# EAGLE design powerSupply (EAGLE 7.7.0)
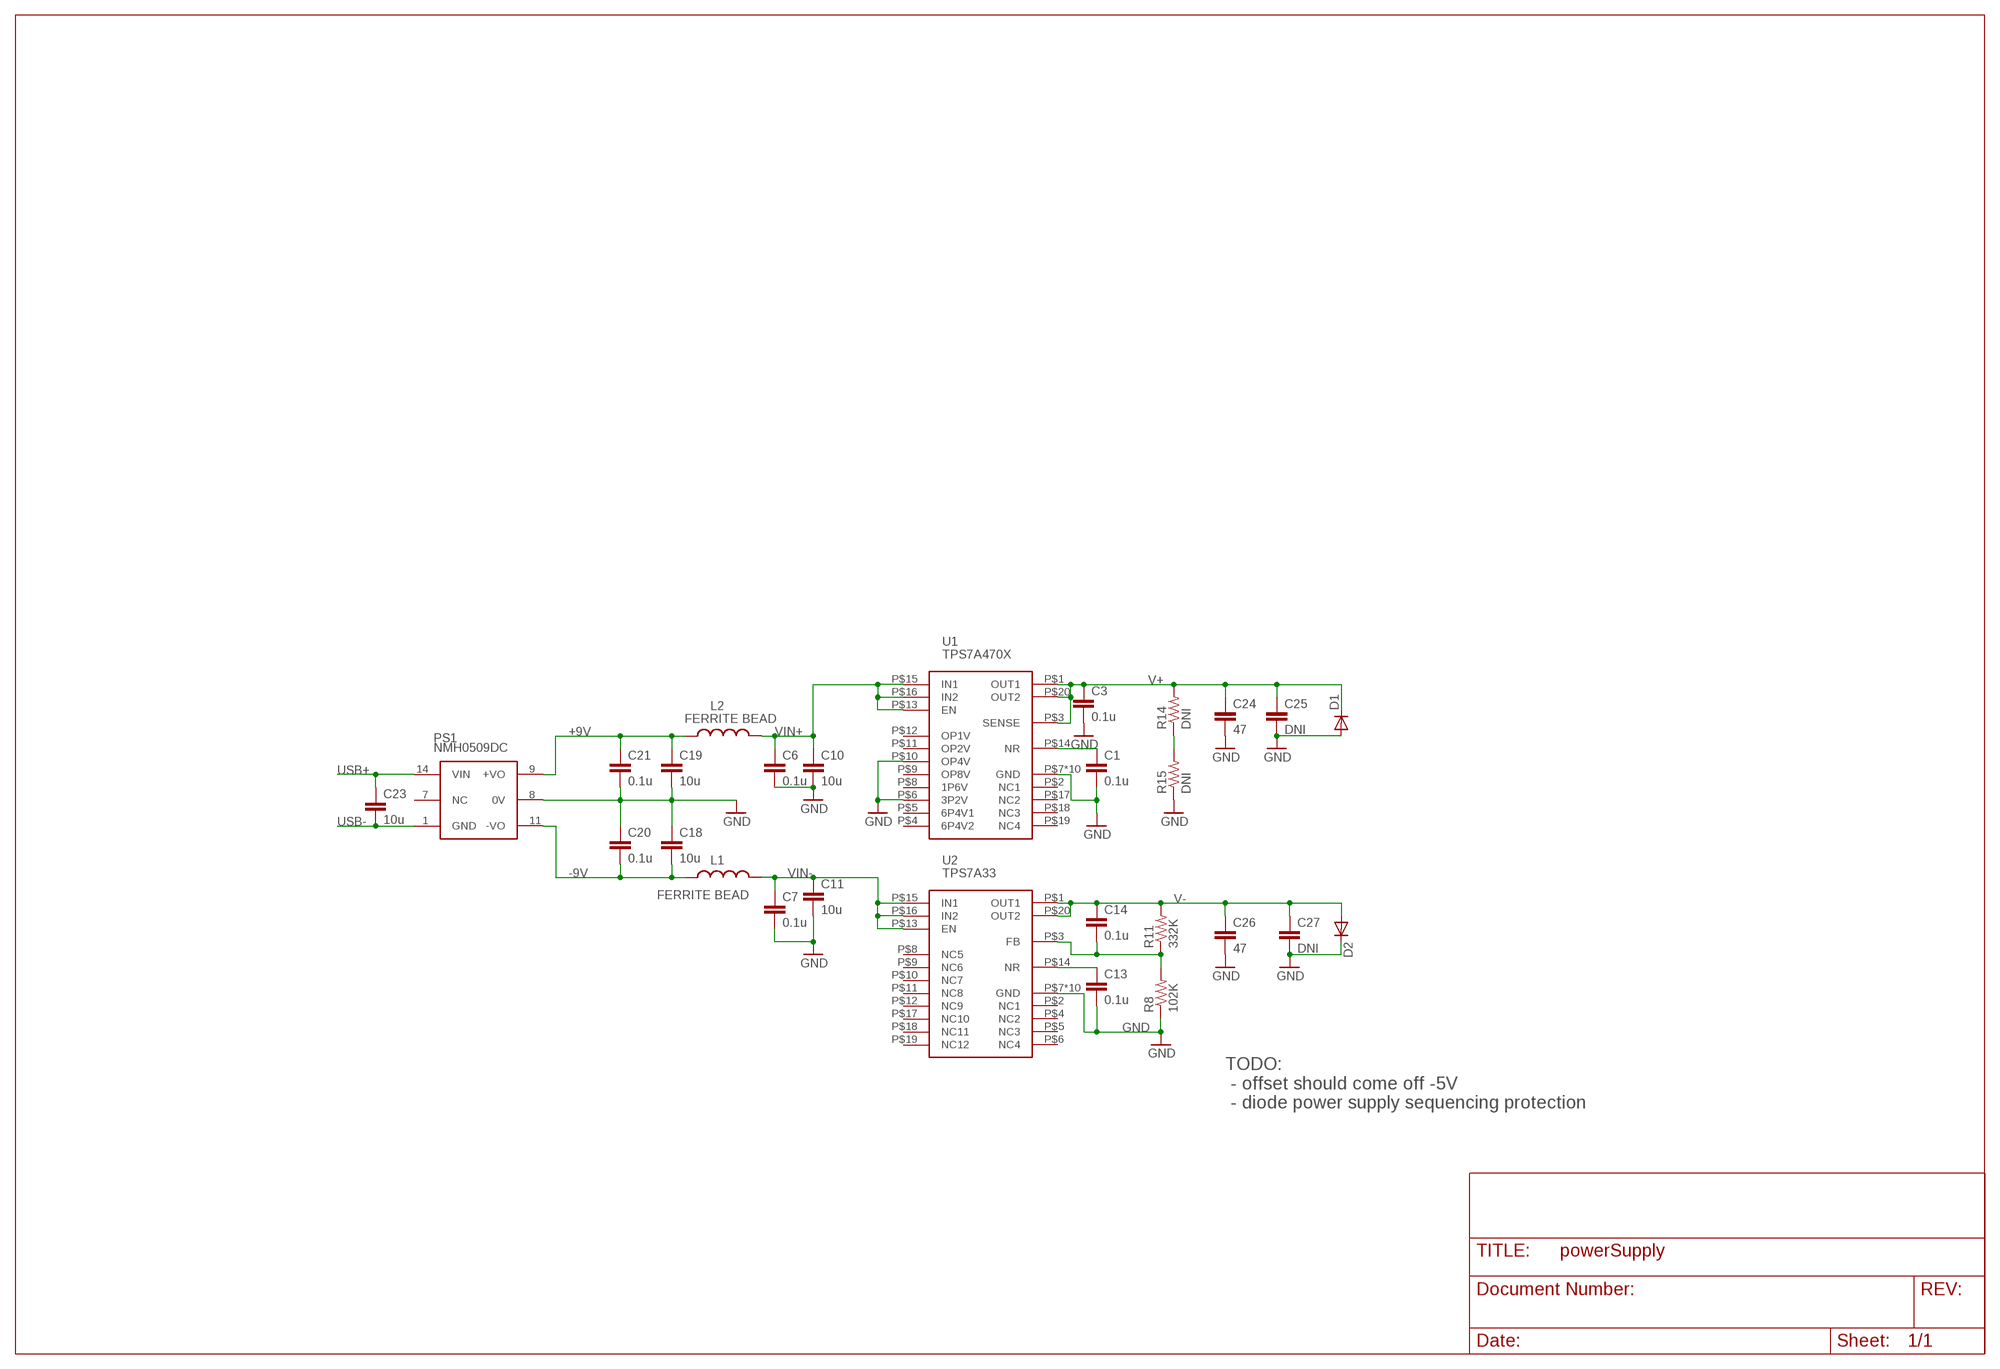
[diagram p0: schematic, sheet 1]

## Parts
C1  0.1u  CAPS0603S  [0603S]
C3  0.1u  CAPS0603S  [0603S]
C6  0.1u  CAPS0603S  [0603S]
C7  0.1u  CAPS0603S  [0603S]
C10  10u  C-EUC1206  [C1206]
C11  10u  C-EUC1206  [C1206]
C13  0.1u  CAPS0603S  [0603S]
C14  0.1u  CAPS0603S  [0603S]
C18  10u  C-EUC1206  [C1206]
C19  10u  C-EUC1206  [C1206]
C20  0.1u  CAPS0603S  [0603S]
C21  0.1u  CAPS0603S  [0603S]
C23  10u  C-EUC1206  [C1206]
C24  47  C-EUC1206  [C1206]
C25  DNI  C-EUC1206  [C1206]
C26  47  C-EUC1206  [C1206]
C27  DNI  C-EUC1206  [C1206]
D1  DIODESMA  [SMA-DIODE]
D2  DIODESMA  [SMA-DIODE]
L1  FERRITE BEAD  INDUCTOR_SM0805S  [0805S]
L2  FERRITE BEAD  INDUCTOR_SM0805S  [0805S]
PS1  NMH0509DC  DC-DC-PDS1-DUALPDM2  [PDM2]
R8  102K  R-US_R0805  [R0805]
R11  332K  R-US_R0805  [R0805]
R14  DNI  R-US_R0805  [R0805]
R15  DNI  R-US_R0805  [R0805]
U1  TPS7A470X  [VQFN-20-5X5]
U2  TPS7A33  [VQFN-20-5X5]

## Nets
+9V: C19.1 C21.1 L2.1 PS1.9(+VO)
-9V: C18.2 C20.2 L1.1 PS1.11(-VO)
GND: C1.2 C3.2 C6.2 C7.2 C10.2 C11.2 C13.2 C18.1 C19.2 C20.1 C21.2 C24.2 C25.2 C26.2 C27.2 D1.A D2.C PS1.8(0V) R8.1 R15.1 U1.P$6(3P2V) U1.P$7(GND) U1.P$10(OP4V) U1.PAD1(GND) U1.PAD2(GND) U1.PAD3(GND) U1.PAD4(GND) U1.PAD5(GND) U1.PAD6(GND) U1.PAD7(GND) U1.PAD8(GND) U1.PAD9(GND) U2.P$7(GND) U2.PAD1(GND) U2.PAD2(GND) U2.PAD3(GND) U2.PAD4(GND) U2.PAD5(GND) U2.PAD6(GND) U2.PAD7(GND) U2.PAD8(GND) U2.PAD9(GND)
N$9: C14.2 R8.2 R11.1 U2.P$3(FB)
N$15: R14.1 R15.2
N$18: C13.1 U2.P$14(NR)
N$23: C1.1 U1.P$14(NR)
USB+: C23.1 PS1.14(VIN)
USB-: C23.2 PS1.1(GND)
V+: C3.1 C24.1 C25.1 D1.C R14.2 U1.P$1(OUT1) U1.P$3(SENSE) U1.P$20(OUT2)
V-: C14.1 C26.1 C27.1 D2.A R11.2 U2.P$1(OUT1) U2.P$20(OUT2)
VIN+: C6.1 C10.1 L2.2 U1.P$13(EN) U1.P$15(IN1) U1.P$16(IN2)
VIN-: C7.1 C11.1 L1.2 U2.P$13(EN) U2.P$15(IN1) U2.P$16(IN2)
Unconnected: PS1.7(NC) U1.P$2(NC1) U1.P$4(6P4V2) U1.P$5(6P4V1) U1.P$8(1P6V) U1.P$9(OP8V) U1.P$11(OP2V) U1.P$12(OP1V) U1.P$17(NC2) U1.P$18(NC3) U1.P$19(NC4) U2.P$2(NC1) U2.P$4(NC2) U2.P$5(NC3) U2.P$6(NC4) U2.P$8(NC5) U2.P$9(NC6) U2.P$10(NC7) U2.P$11(NC8) U2.P$12(NC9) U2.P$17(NC10) U2.P$18(NC11) U2.P$19(NC12)

## Notes on the sheet
- TODO:
   - offset should come off -5V
   - diode power supply sequencing protection

## Library data of the parts
C1 C3 C6 C7 C13 C14 C20 C21 = STEVES_BU:CAPS
C10 C11 C18 C19 C23-C27 = rcl:C-EU: CAPACITOR, European symbol
D1 D2 = SparkFun:DIODE: Diode These are standard reverse protection diodes and small signal diodes. SMA package can handle up to about 1A. SOD-323 can handle about 200mA. What the SOD-323 package when ordering, there are some mfgs out there that are 5-pin packages.
L1 L2 = STEVES_BU:INDUCTOR_SM
PS1 = STEVES_BU:DC-DC-PDS1-DUAL
R8 R11 R14 R15 = rcl:R-US_: RESISTOR, American symbol
U1 = STEVES_BU:TPS7A470X
U2 = STEVES_BU:TPS7A33: TPS7A33 –36-V, 1-A, Ultralow-Noise Negative Voltage Regulator

## Board
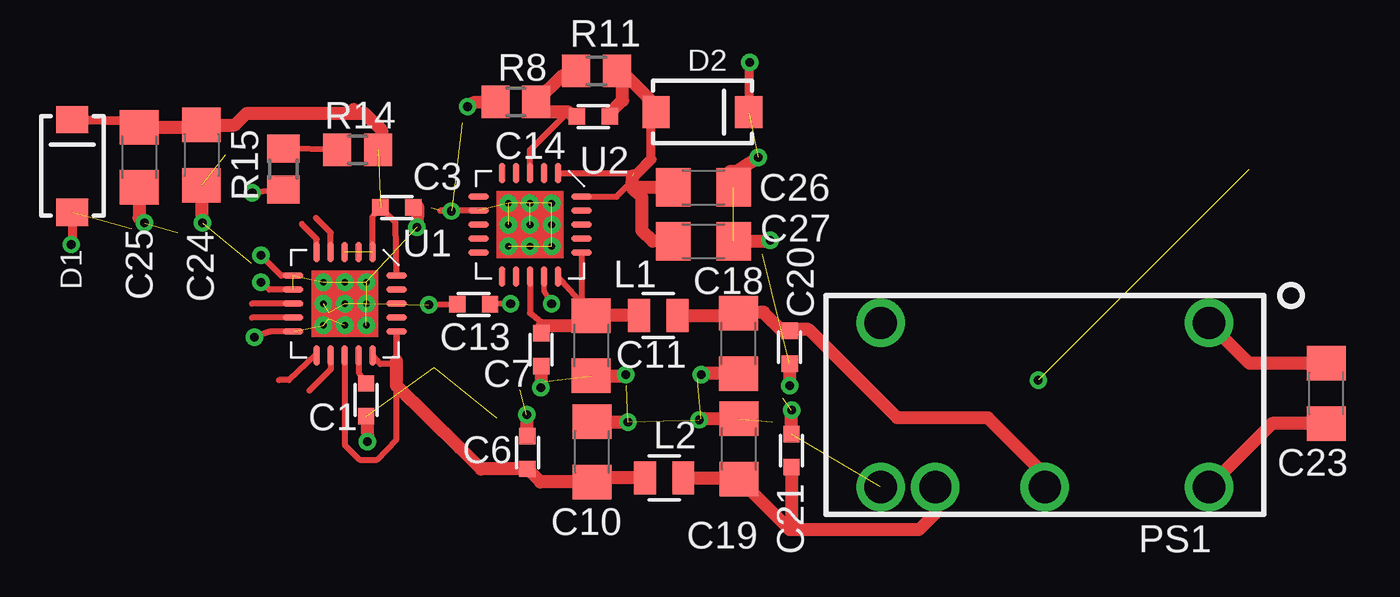
[diagram p1: board, top side]
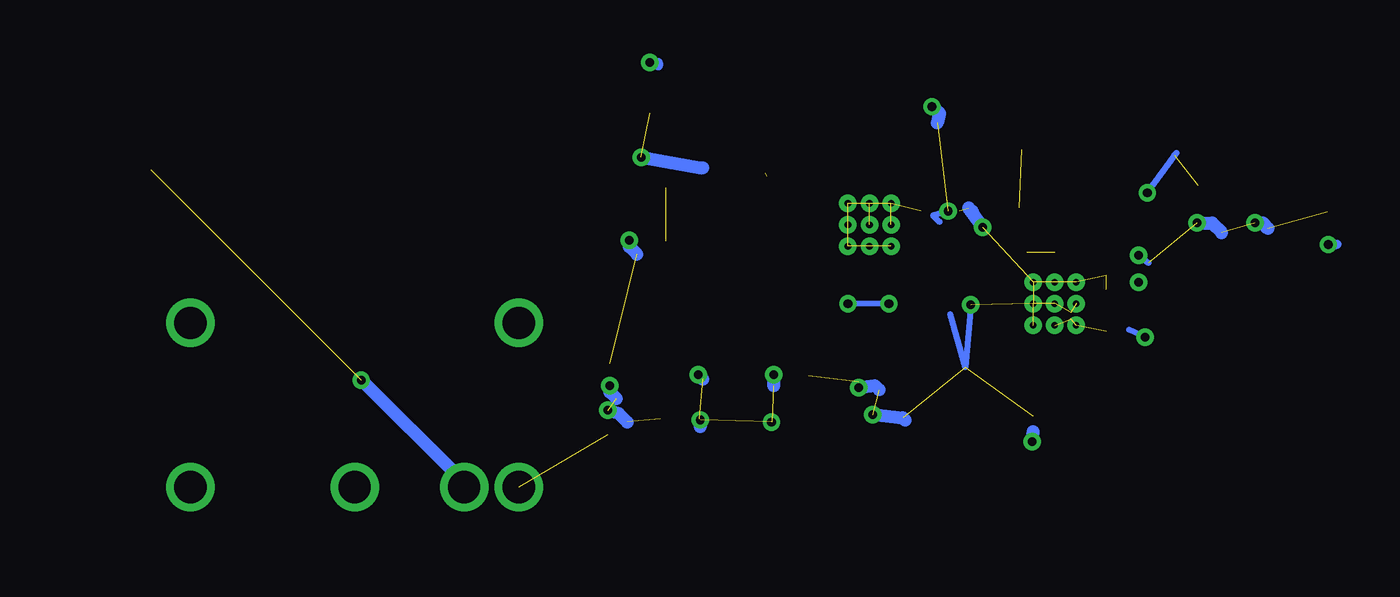
[diagram p2: board, bottom side, seen from below]

No outline drawn. Coordinates in mm, seen from the top.
Copper layers (1*16): Top 0.035mm / dielectric 1.5mm / Bottom 0.035mm
Design rules "default *": minimum track width 10mil, minimum drill 17mil, track to track 8mil, track to pad 8mil, pad to pad 8mil, via to via 8mil, smd to smd 8mil, copper to edge 40mil, drill to drill 8mil, minimum pad ring 10mil, minimum via ring 8mil, stop-mask expansion 4mil, vias tented up to drill 25mil, thermal gap 10mil

### Footprints (pad centres in the part's own frame; a part is rotated, then mirrored left to right if it is on the bottom)
0603S = smd 0.762 x 0.762: 1 -0.762,0; 2 0.762,0
C1206 = smd 1.6 x 1.8: 1 -1.4,0; 2 1.4,0
SMA-DIODE = smd 1.27 x 1.47: A -2.15,0; C 2.15,0
0805S = smd 1.016 x 1.524: 1 -0.889,0; 2 0.889,0
PDM2 = drill 1.5: 1 -7.62,-3.81; 7 7.62,-3.81; 8 7.62,3.81; 9 5.08,3.81; 11 0,3.81; 14 -7.62,3.81
R0805 = smd 1.3 x 1.5: 1 -0.95,0; 2 0.95,0
VQFN-20-5X5 = smd 0.95 x 0.3: P$1 -2.4,1.3; P$2 -2.4,0.65; P$3 -2.4,0; P$4 -2.4,-0.65; P$5 -2.4,-1.3; P$11 2.4,-1.3; P$12 2.4,-0.65; P$13 2.4,0; P$14 2.4,0.65; P$15 2.4,1.3 | smd 0.3 x 0.95: P$6 -1.3,-2.4; P$7 -0.65,-2.4; P$8 0,-2.4; P$9 0.65,-2.4; P$10 1.3,-2.4; P$16 1.3,2.4; P$17 0.65,2.4; P$18 0,2.4; P$19 -0.65,2.4; P$20 -1.3,2.4 | drill 0.305: PAD1 -1,1; PAD2 0,1; PAD3 1,1; PAD4 -1,0; PAD5 0,0; PAD6 1,0; PAD7 -1,-1; PAD8 0,-1; PAD9 1,-1

### Placement (x,y rotation side)
C1  16.54,8.53 270 top
C3  17.97,17.47 0 top
C6  24.03,6.09 90 top
C7  24.67,10.86 270 top
C10  27.03,6.12 90 top
C11  26.99,11.05 270 top
C13  21.53,12.97 180 top
C14  27.08,21.69 180 top
C18  33.82,11.16 90 top
C19  33.85,6.26 90 top
C20  36.2,10.97 90 top
C21  36.29,6.17 90 top
C23  61.12,8.83 90 top
C24  8.9,19.9 270 top
C25  6,19.8 270 top
C26  32.2,18.4 0 top
C27  32.2,15.9 0 top
D1  2.9,19.4 90 top
D2  32.15,21.9 0 top
L1  30.1,12.46 180 top
L2  30.38,4.91 180 top
PS1  48.05,8.3 180 top
R8  23.49,22.38 0 top
R11  27.24,23.81 0 top
R14  16.15,20.15 0 top
R15  12.7,19.25 90 top
U1  15.55,13 270 top
U2  24.15,16.67 270 top

### Tracks (layer width: path | path; a pad name or v marks a point on that pad's centre or on a via)
+9V  (via drill 0.4)  (1 unrouted)
  Top 0.61: PS1.9 42.97,3.27 42.2,2.5 36.6,2.5 | 36.6,2.5 36.21,2.5 C19.1 33.81,4.91 L2.1 | C21.1 36.29,2.81 36.6,2.5
  Bottom 0.61: v47.75,9.45 43.18,4.9 PS1.9
-9V
  Top 0.61: PS1.11 48.05,5.05 45.4,7.7 41.2,7.7 37.1,11.8 36.27,11.8 C20.2 35.86,11.74 35,12.6 33.87,12.6 C18.2 33.72,12.46 L1.1
GND  (via drill 0.4)  (42 unrouted)
  Top 0.28: C13.2 | C13.2 v19.45,12.95 | U1.P$7 12.05,13.65 v11.65,14 | 14.8,12.3 14.8,12.6 | U2.P$7 19.98,17.32 v20.5,17.3 | U1.P$10 12.1,11.7 v11.35,11.45 | U1.P$6 12.6,14.3 v11.65,15.25 | R15.1 v11.25,18.15
  Top 0.406: D1.A 2.9,15.7 2.8,15.75 v2.85,15.75 | D2.C 34.15,21.9 34.15,21.85 34.35,21.85 v34.35,24.2
  Top 0.61: R8.1 21.53,22.33 v21.25,22.15 | C10.2 28.68,7.52 v28.7,7.5 | C11.2 28.55,9.65 v28.6,9.7 | C18.1 32.16,9.76 v32.1,9.7 | C19.2 32.06,7.66 v32,7.6 | C20.1 v36.2,9.2 | C21.2 v36.29,8.04 v36.3,8.05 | C7.2 24.67,9.37 v24.65,9.1 | C6.2 23.98,7.83 v24,7.85 | C1.2 16.59,7.31 v16.6,6.6 | C3.2 18.93,17.47 v18.9,16.55 | C26.2 33.6,18.75 | 33.6,18.75 33.6,19.15 33.45,19.15 33.6,18.75 | 33.6,18.75 33.65,19.1 v34.75,19.8 | C27.2 35.25,15.9 v35.3,15.95 | C24.2 8.9,16.8 v8.95,16.75 | C25.2 6,17 v6.25,16.75
  Bottom 0.28: v19.45,12.95 19.7,10.05 20.4,12.5 | v11.65,14 11.75,13.9 | v20.5,17.3 21.2,17.1 20.9,16.8 | v11.35,11.45 12.1,11.8 | v11.65,15.25 11.2,14.9 | v11.25,18.15 9.9,20 10,19.9
  Bottom 0.406: v2.85,15.75 2.45,15.75 | v34.35,24.2 33.95,24.2 33.95,24.05
  Bottom 0.61: v21.25,22.15 20.9,21.85 21,21.4 | v28.7,7.5 28.7,7.4 | v28.6,9.7 28.6,9.2 | v32.1,9.7 31.9,9.5 | v32,7.6 32,7.3 | v36.2,9.2 36.2,8.9 35.9,8.6 | v36.3,8.05 35.8,7.9 35.4,7.5 | v24.65,9.1 23.9,9.2 23.7,9 | v24,7.85 22.6,7.7 22.5,7.6 | v16.6,6.6 16.55,7.05 | v18.9,16.55 19.55,17.45 19.35,17.25 | v34.75,19.8 33.35,19.55 31.9,19.3 | v35.3,15.95 35.3,15.65 34.95,15.3 | v8.95,16.75 8.25,16.75 7.8,16.3 | v6.25,16.75 5.9,16.75 5.65,16.5
N$8
  Top 0.28: 13.5,13 11.25,13
N$9
  Top 0.28: U2.P$3 24.15,20.14 25.92,21.91
  Top 0.61: C14.2 26.03,21.83 25.92,21.91 24.5,21.9 24.35,22.22 R8.2 25.69,23.61 26.37,23.58 R11.1
N$10
  Top 0.28: 13,12.35 11.25,12.35
N$11
  Top 0.28: 14.2,10.65 12.95,9.45 12.5,9.45
N$12
  Top 0.28: 14.9,10.4 14.9,9.95 13.9,8.95
N$14
  Top 0.28: 14.25,15.3 14.25,16 13.55,16.7
N$15
  Top 0.28: R14.1 R15.2
N$18  (via drill 0.4)
  Top 0.254: U2.P$14 24.8,13.6 v25.15,13 | v23.25,13 22.62,13 C13.1
  Bottom 0.254: v25.15,13 v23.25,13
N$20
  Top 0.28: 14.9,15.45 14.9,16.3 14.2,17
N$23
  Top 0.28: 16.3,9.5 16.29,9.59 C1.1 16.2,9.78 U1.P$14
USB+
  Top 0.61: C23.1 58.61,7.43 PS1.14
USB-
  Top 0.61: C23.2 57.55,10.23 PS1.1
V+  (2 unrouted)
  Top 0.28: U1.P$1 16.85,17.06 C3.1 | U1.P$20 17.9,16.77 C3.1 | 17.17,17.3 C3.1
  Top 0.406: D1.C 6,21.5 C25.1
  Top 0.61: C25.1 8.8,21.2 C24.1 10.45,21.3 11,21.85 16.15,21.85 | 16.15,21.85 16.45,21.85 17.25,21.05 17.25,20.3 R14.2 | 15.97,22.02 16.15,21.85
V-  (1 unrouted)
  Top 0.28: U2.P$1 28.97,19.07 29.75,19.85 | U2.P$20 28.17,17.97 29.9,19.7 29.75,19.85 | 29.75,19.85 29.75,19.9 29.75,22 29.9,22 | 28.29,23.45 R11.2
  Top 0.406: D2.A 29.75,21.9 29.75,19.9
  Top 0.61: C26.1 28.9,18.4 | 28.9,18.4 28.92,18.93 | C27.1 29.85,15.9 29.35,16.4 29.35,17.95 28.9,18.4 | 29.9,22 29.9,22.3 28.69,23.51 R11.2 28.45,23.55 28.45,22.45 27.84,21.84 C14.1
VIN+
  Top 0.28: U1.P$15 17.2,10.2 17.9,10.2 17.95,10.35 U1.P$16 17.95,10.2 17.95,9.2 17.95,6.7 17.05,5.75 16.25,5.75 15.55,6.45 15.55,9.45 15.55,9.65 U1.P$13
  Top 0.61: L2.2 26.72,4.91 C10.1 24.64,4.72 C6.1 21.87,5.33 20.9,6.3 17.95,9.2 17.95,10.35
VIN-
  Top 0.28: U2.P$16 26.55,13.21 28.1,12.46 | U2.P$15 26.75,12.8 27.1,12.46 | U2.P$13 24.15,12.56 24.9,11.96
  Top 0.61: L1.2 28.1,12.46 27.1,12.46 26.64,11.96 | 26.64,11.96 C11.1 | 26.64,11.96 24.9,11.96 24.71,11.96 C7.1

### Text on the board
tPlace: OUT